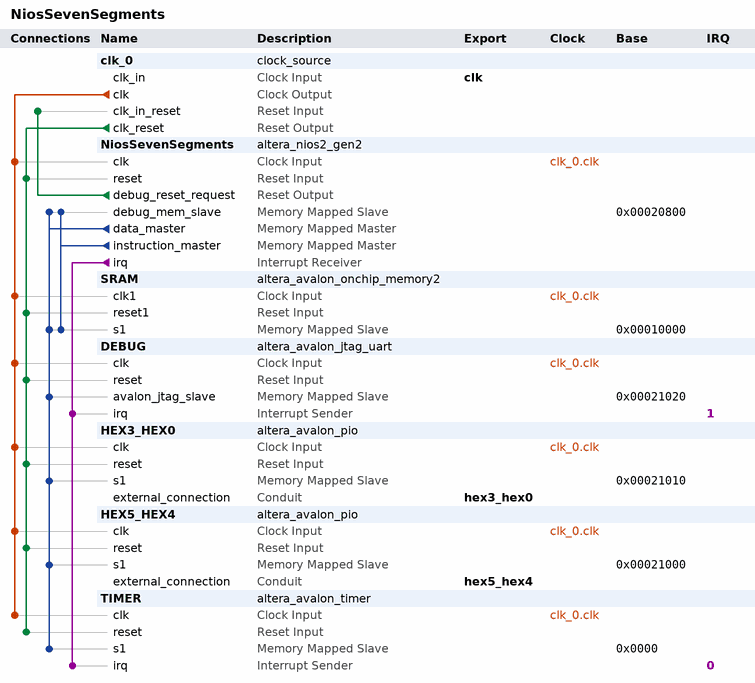
[diagram p0: system contents]
# Platform Designer (Qsys) system NiosSevenSegments, Cyclone V 5CSEMA5F31C6
# Parameters at their usual value, and those the tool derives, are not listed.
package require -exact qsys 18.1
create_system NiosSevenSegments
set_project_property DEVICE_FAMILY {Cyclone V}
set_project_property DEVICE 5CSEMA5F31C6

add_instance clk_0 clock_source 18.1
set_instance_parameter_value clk_0 clockFrequency 50000000

add_instance NiosSevenSegments altera_nios2_gen2 18.1
set_instance_parameter_value NiosSevenSegments dcache_size 2048
set_instance_parameter_value NiosSevenSegments exceptionSlave SRAM.s1
set_instance_parameter_value NiosSevenSegments icache_size 4096
set_instance_parameter_value NiosSevenSegments impl Tiny
set_instance_parameter_value NiosSevenSegments resetSlave SRAM.s1

add_instance SRAM altera_avalon_onchip_memory2 18.1
set_instance_parameter_value SRAM dataWidth 32
set_instance_parameter_value SRAM dualPort false
set_instance_parameter_value SRAM initMemContent true
set_instance_parameter_value SRAM initializationFileName onchip_mem.hex
set_instance_parameter_value SRAM memorySize 40960

add_instance DEBUG altera_avalon_jtag_uart 18.1
set_instance_parameter_value DEBUG simInteractiveOptions NO_INTERACTIVE_WINDOWS

add_instance HEX3_HEX0 altera_avalon_pio 18.1
set_instance_parameter_value HEX3_HEX0 direction Output
set_instance_parameter_value HEX3_HEX0 width 32

add_instance HEX5_HEX4 altera_avalon_pio 18.1
set_instance_parameter_value HEX5_HEX4 direction Output
set_instance_parameter_value HEX5_HEX4 width 16

add_instance TIMER altera_avalon_timer 18.1
set_instance_parameter_value TIMER period 500
set_instance_parameter_value TIMER periodUnits MSEC

# connections
add_connection clk_0.clk DEBUG.clk clock
add_connection clk_0.clk HEX3_HEX0.clk clock
add_connection clk_0.clk HEX5_HEX4.clk clock
add_connection clk_0.clk NiosSevenSegments.clk clock
add_connection clk_0.clk SRAM.clk1 clock
add_connection clk_0.clk TIMER.clk clock
add_connection clk_0.clk_reset DEBUG.reset reset
add_connection clk_0.clk_reset HEX3_HEX0.reset reset
add_connection clk_0.clk_reset HEX5_HEX4.reset reset
add_connection clk_0.clk_reset NiosSevenSegments.reset reset
add_connection clk_0.clk_reset SRAM.reset1 reset
add_connection clk_0.clk_reset TIMER.reset reset
add_connection NiosSevenSegments.debug_reset_request clk_0.clk_in_reset reset
add_connection NiosSevenSegments.data_master DEBUG.avalon_jtag_slave avalon
set_connection_parameter_value NiosSevenSegments.data_master/DEBUG.avalon_jtag_slave baseAddress 0x00021020
add_connection NiosSevenSegments.data_master HEX3_HEX0.s1 avalon
set_connection_parameter_value NiosSevenSegments.data_master/HEX3_HEX0.s1 baseAddress 0x00021010
add_connection NiosSevenSegments.data_master HEX5_HEX4.s1 avalon
set_connection_parameter_value NiosSevenSegments.data_master/HEX5_HEX4.s1 baseAddress 0x00021000
add_connection NiosSevenSegments.data_master NiosSevenSegments.debug_mem_slave avalon
set_connection_parameter_value NiosSevenSegments.data_master/NiosSevenSegments.debug_mem_slave baseAddress 0x00020800
add_connection NiosSevenSegments.data_master SRAM.s1 avalon
set_connection_parameter_value NiosSevenSegments.data_master/SRAM.s1 baseAddress 0x00010000
add_connection NiosSevenSegments.data_master TIMER.s1 avalon
set_connection_parameter_value NiosSevenSegments.data_master/TIMER.s1 baseAddress 0x0000
add_connection NiosSevenSegments.instruction_master NiosSevenSegments.debug_mem_slave avalon
set_connection_parameter_value NiosSevenSegments.instruction_master/NiosSevenSegments.debug_mem_slave baseAddress 0x00020800
add_connection NiosSevenSegments.instruction_master SRAM.s1 avalon
set_connection_parameter_value NiosSevenSegments.instruction_master/SRAM.s1 baseAddress 0x00010000
add_connection NiosSevenSegments.irq DEBUG.irq interrupt
set_connection_parameter_value NiosSevenSegments.irq/DEBUG.irq irqNumber 1
add_connection NiosSevenSegments.irq TIMER.irq interrupt
set_connection_parameter_value NiosSevenSegments.irq/TIMER.irq irqNumber 0

# exported interfaces
add_interface clk clock sink
set_interface_property clk EXPORT_OF clk_0.clk_in
add_interface hex3_hex0 conduit end
set_interface_property hex3_hex0 EXPORT_OF HEX3_HEX0.external_connection
add_interface hex5_hex4 conduit end
set_interface_property hex5_hex4 EXPORT_OF HEX5_HEX4.external_connection

set_interconnect_requirement {$system} qsys_mm.clockCrossingAdapter HANDSHAKE
set_interconnect_requirement {$system} qsys_mm.enableEccProtection FALSE
set_interconnect_requirement {$system} qsys_mm.insertDefaultSlave FALSE
set_interconnect_requirement {$system} qsys_mm.maxAdditionalLatency 1

save_system NiosSevenSegments.qsys
